# Altium schematic sheet JEDEC_TSSOP54_SDRAM.SchDoc: JEDEC TSSOP54 SDRAM
size A4; SheetNumber: 7; SheetTotal: 9
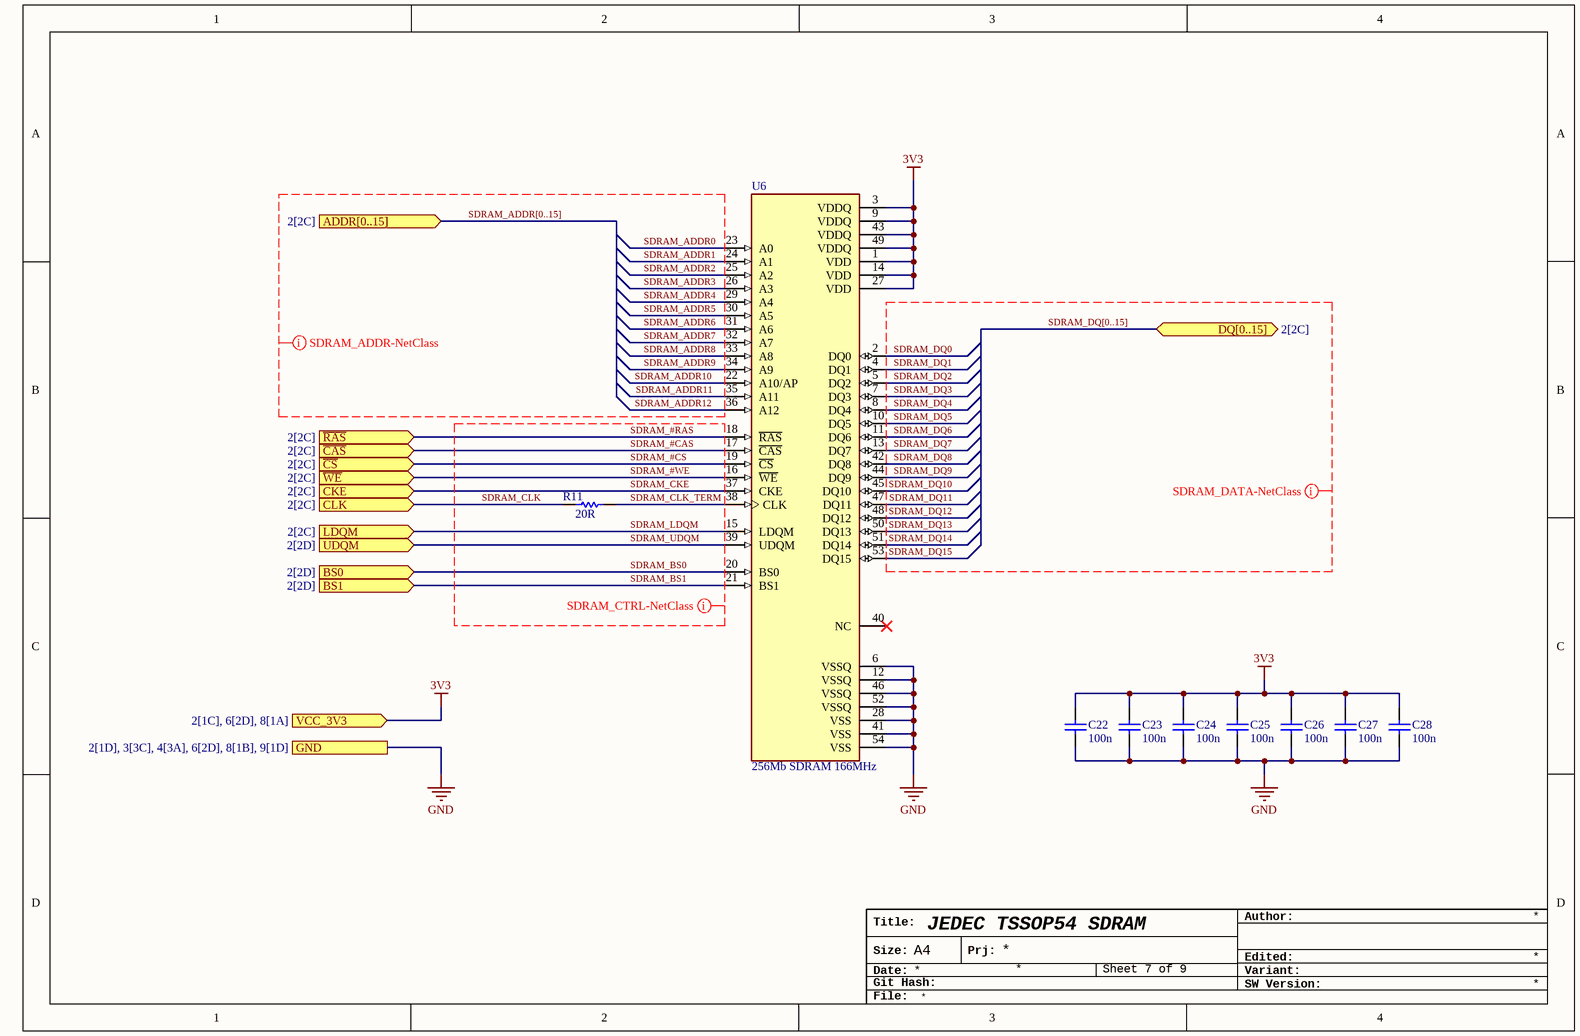
[diagram p0: JEDEC_TSSOP54_SDRAM.SchDoc]

## Parts
C22  value 100n  [CAPC1607X09L - 0603]  (hidden comment: 100nF 50V)
C23  value 100n  [CAPC1607X09L - 0603]  (hidden comment: 100nF 50V)
C24  value 100n  [CAPC1607X09L - 0603]  (hidden comment: 100nF 50V)
C25  value 100n  [CAPC1607X09L - 0603]  (hidden comment: 100nF 50V)
C26  value 100n  [CAPC1607X09L - 0603]  (hidden comment: 100nF 50V)
C27  value 100n  [CAPC1607X09L - 0603]  (hidden comment: 100nF 50V)
C28  value 100n  [CAPC1607X09L - 0603]  (hidden comment: 100nF 50V)
R11  20R  [RESC1508X05L - 0603]
U6  256Mb SDRAM 166MHz  [TSSOP54_GEN]

## Ports
ADDR[0..15] (in, see 2[2C]), BS0 (in, see 2[2D]), BS1 (in, see 2[2D]), CKE (in, see 2[2C]), CLK (in, see 2[2C]), DQ[0..15] (bidir, see 2[2C]), GND (see 2[1D], 3[3C], 4[3A], 6[2D], 8[1B], 9[1D]), LDQM (in, see 2[2C]), UDQM (in, see 2[2D]), VCC_3V3 (in, see 2[1C], 6[2D], 8[1A]), ~{CAS} (in, see 2[2C]), ~{CS} (in, see 2[2C]), ~{RAS} (in, see 2[2C]), ~{WE} (in, see 2[2C])

## Nets
3V3: C22.2 C23.2 C24.2 C25.2 C26.2 C27.2 C28.2 U6.1(VDD) U6.3(VDDQ) U6.9(VDDQ) U6.14(VDD) U6.27(VDD) U6.43(VDDQ) U6.49(VDDQ) ; port VCC_3V3
GND: C22.1 C23.1 C24.1 C25.1 C26.1 C27.1 C28.1 U6.6(VSSQ) U6.12(VSSQ) U6.28(VSS) U6.41(VSS) U6.46(VSSQ) U6.52(VSSQ) U6.54(VSS) ; port GND
SDRAM_#CAS: U6.17(~{CAS}) ; port ~{CAS}
SDRAM_#CS: U6.19(~{CS}) ; port ~{CS}
SDRAM_#RAS: U6.18(~{RAS}) ; port ~{RAS}
SDRAM_#WE: U6.16(~{WE}) ; port ~{WE}
SDRAM_ADDR0: U6.23(A0)
SDRAM_ADDR1: U6.24(A1)
SDRAM_ADDR2: U6.25(A2)
SDRAM_ADDR3: U6.26(A3)
SDRAM_ADDR4: U6.29(A4)
SDRAM_ADDR5: U6.30(A5)
SDRAM_ADDR6: U6.31(A6)
SDRAM_ADDR7: U6.32(A7)
SDRAM_ADDR8: U6.33(A8)
SDRAM_ADDR9: U6.34(A9)
SDRAM_ADDR10: U6.22(A10/AP)
SDRAM_ADDR11: U6.35(A11)
SDRAM_ADDR12: U6.36(A12)
SDRAM_BS0: U6.20(BS0) ; port BS0
SDRAM_BS1: U6.21(BS1) ; port BS1
SDRAM_CKE: U6.37(CKE) ; port CKE
SDRAM_CLK: R11.1 ; port CLK
SDRAM_CLK_TERM: R11.2 U6.38(CLK)
SDRAM_DQ0: U6.2(DQ0)
SDRAM_DQ1: U6.4(DQ1)
SDRAM_DQ2: U6.5(DQ2)
SDRAM_DQ3: U6.7(DQ3)
SDRAM_DQ4: U6.8(DQ4)
SDRAM_DQ5: U6.10(DQ5)
SDRAM_DQ6: U6.11(DQ6)
SDRAM_DQ7: U6.13(DQ7)
SDRAM_DQ8: U6.42(DQ8)
SDRAM_DQ9: U6.44(DQ9)
SDRAM_DQ10: U6.45(DQ10)
SDRAM_DQ11: U6.47(DQ11)
SDRAM_DQ12: U6.48(DQ12)
SDRAM_DQ13: U6.50(DQ13)
SDRAM_DQ14: U6.51(DQ14)
SDRAM_DQ15: U6.53(DQ15)
SDRAM_LDQM: U6.15(LDQM) ; port LDQM
SDRAM_UDQM: U6.39(UDQM) ; port UDQM

Not connected (* = marked no-connect by the designer): U6 40(NC)*

## Buses and harness runs
bus SDRAM_ADDR[0..15] = port ADDR[0..15]
bus SDRAM_DQ[0..15] = port DQ[0..15]

## Layout directives
net class SDRAM_ADDR: SDRAM_#CAS, SDRAM_#CS, SDRAM_#RAS, SDRAM_#WE, SDRAM_ADDR0, SDRAM_ADDR1, SDRAM_ADDR2, SDRAM_ADDR3, SDRAM_ADDR4, SDRAM_ADDR5, SDRAM_ADDR6, SDRAM_ADDR7, SDRAM_ADDR8, SDRAM_ADDR9, SDRAM_ADDR10, SDRAM_ADDR11, SDRAM_ADDR12, SDRAM_ADDR[0..15], SDRAM_BS0, SDRAM_BS1, SDRAM_CKE, SDRAM_CLK, SDRAM_CLK_TERM, SDRAM_LDQM, SDRAM_UDQM
net class SDRAM_DATA: SDRAM_DQ0, SDRAM_DQ1, SDRAM_DQ2, SDRAM_DQ3, SDRAM_DQ4, SDRAM_DQ5, SDRAM_DQ6, SDRAM_DQ7, SDRAM_DQ8, SDRAM_DQ9, SDRAM_DQ10, SDRAM_DQ11, SDRAM_DQ12, SDRAM_DQ13, SDRAM_DQ14, SDRAM_DQ15, SDRAM_DQ[0..15]

## Notes on the sheet
- Title:
- Author:
- Size:
- Date:
- Git Hash:
- A4
- Prj:
- SW Version:
- Variant:
- Edited:
- File:

## Library data of the parts
C22-C28 = CAP-0603-100nF-50V-X7R: Ceramic capacitor 100nF 50V X7R 0603; Supplier 1: DigiKey; Supplier Part Number 1: 490-5798-1-ND
R11 = RES-0603-20R-1%: 20R ±1% 0603 100mW 75V; Part Number: 0402WGF1001TCE; Manufacturer: UNI-ROYAL; Supplier 1: DigiKey; Supplier Part Number 1: 13-RC0603FR-1020RLCT-ND; Value: 20R
U6 = IC-SDRAM-256Mb-JEDEC-TSSOP2: SDRAM Memory IC 256Mb (16M x 16) Parallel 166MHz 5ns 54-TSOP II